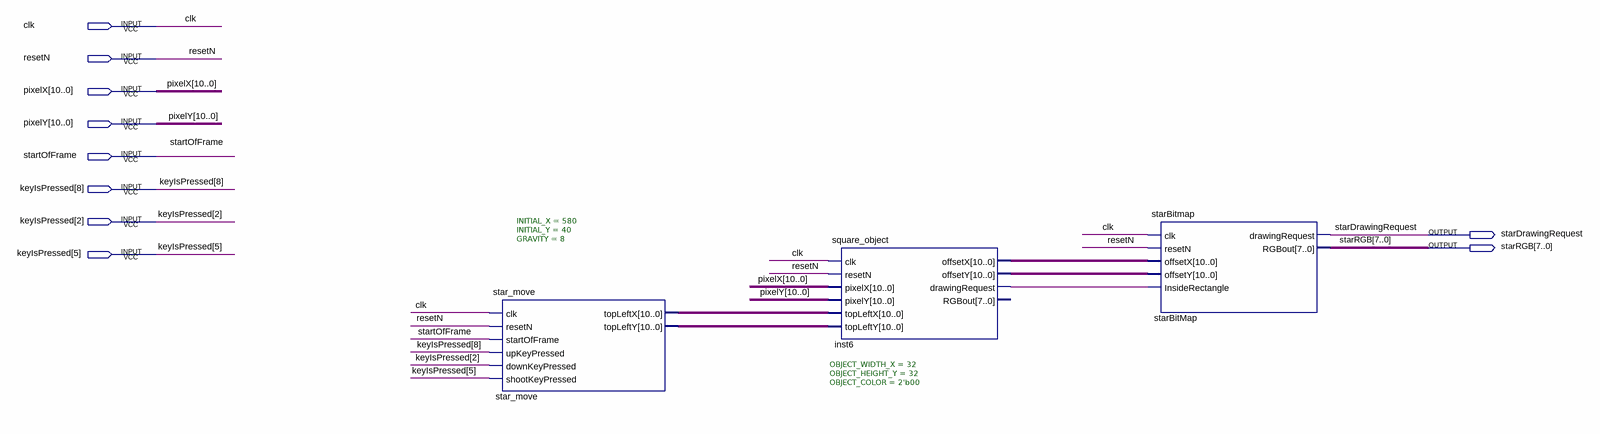
[diagram p0: schematic sheet]
// Quartus schematic STAR_DISPLAY.bdf as structural Verilog: 3 symbols, 10 pins
module STAR_DISPLAY (
  input  clk,
  input  resetN,
  input  [10:0] pixelX,
  input  [10:0] pixelY,
  input  startOfFrame,
  input  [8:2] keyIsPressed,
  output starDrawingRequest,
  output [7:0] starRGB
);

  wire inst6_drawingrequest;
  wire [10:0] inst6_offsetx, inst6_offsety, star_move_topleftx, star_move_toplefty;

  star_move #(.INITIAL_X(580), .INITIAL_Y(40), .GRAVITY(8)) star_move (
    .clk(clk), .resetN(resetN), .startOfFrame(startOfFrame), .upKeyPressed(keyIsPressed[8]),
    .downKeyPressed(keyIsPressed[2]), .shootKeyPressed(keyIsPressed[5]), .topLeftX(star_move_topleftx),
    .topLeftY(star_move_toplefty));
  square_object #(.OBJECT_WIDTH_X(32), .OBJECT_HEIGHT_Y(32), .OBJECT_COLOR(2'b00)) inst6 (
    .clk(clk), .resetN(resetN), .pixelX(pixelX), .pixelY(pixelY), .topLeftX(star_move_topleftx),
    .topLeftY(star_move_toplefty), .offsetX(inst6_offsetx), .offsetY(inst6_offsety),
    .drawingRequest(inst6_drawingrequest));  // open: RGBout
  starBitmap starBitMap (
    .clk(clk), .resetN(resetN), .offsetX(inst6_offsetx), .offsetY(inst6_offsety),
    .InsideRectangle(inst6_drawingrequest), .drawingRequest(starDrawingRequest), .RGBout(starRGB));
endmodule
